# EasyEDA Pro project ProPrj_CraftVia-Core-S-RP235xA-v1-Rev0_2026-11-04.epro, board RPI-RP2350A-MINIMAL_R4-S1
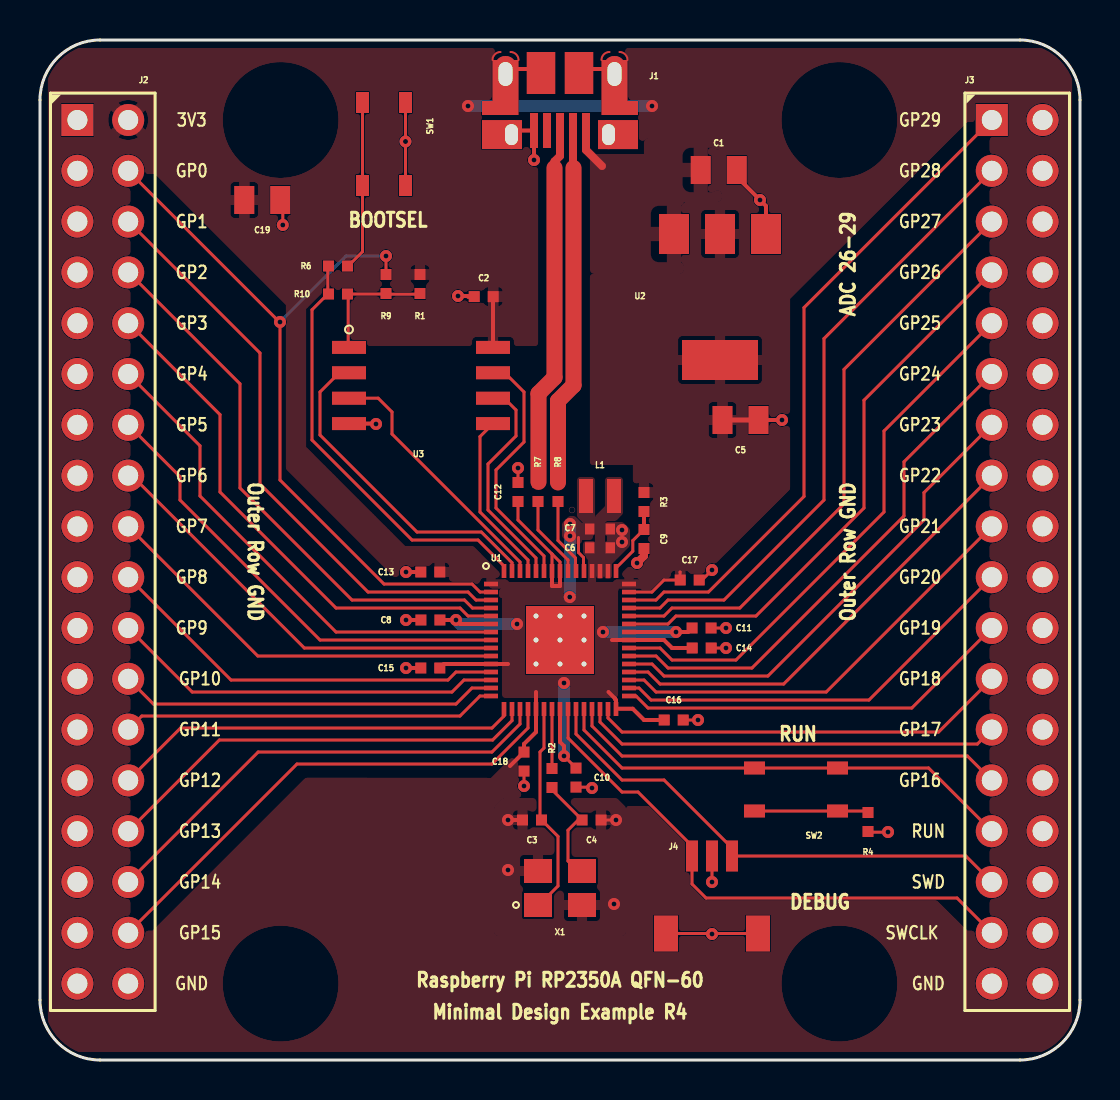
[diagram p4: board, top side]
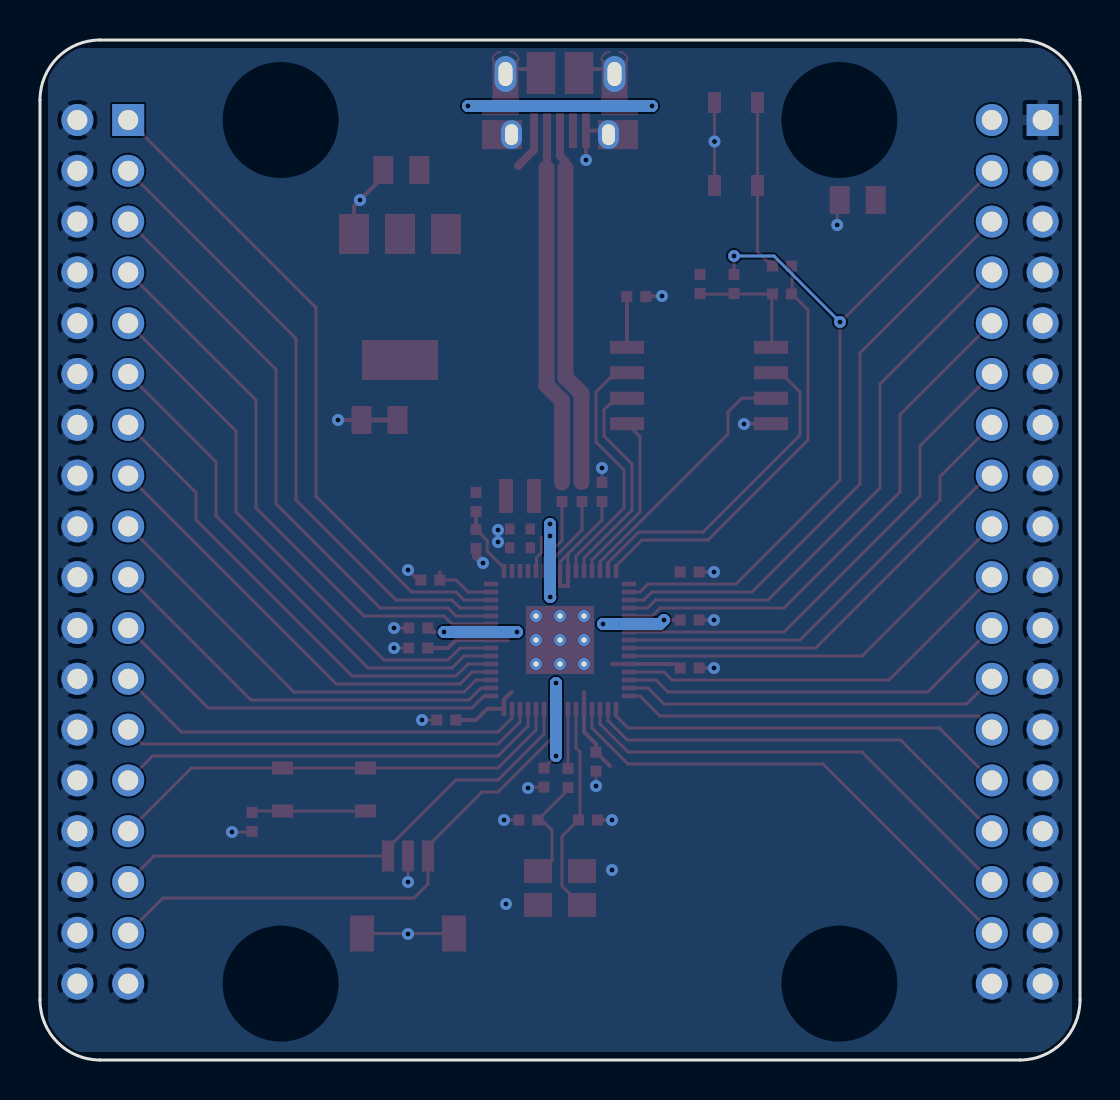
[diagram p5: board, bottom side, seen from below]

Outline 52 x 51 mm; copper layers: Top Layer, Bottom Layer. Coordinates in mm from the lower left corner of the outline.
Outline path: 0,48 arc(0.88,50.12) 3,51 49,51 arc(51.12,50.12) 52,48 52,3 arc(51.12,0.88) 49,0 3,0 arc(0.88,0.88) 0,3 0,48
Stack: Top Layer 0.0009mm / dielectric 1 0.0384mm FR4 er 4.5 / Bottom Layer 0.0009mm

## Design rules (mm)
spacing copperThickness1oz (default): track to track 0.102, other pairs 0.152 to 0.3
track width copperThickness1oz (default): min 0.127, default 0.254, max 2.54
differential pair differentialPair (default): width min 0.127, default 2.54, max 2.54; gap min 0.127, default 0.152
pour e1492 uses copper0
pour e1496 uses copper1
pour e1500 uses copper2
pour e1503 uses copper2
pour e1506 uses copper2
pour e1498 uses copper2
pour e1484 uses copper1
pour e1490 uses copper1
pour e1494 uses copper2
pour e1488 uses copper1
pour e1486 uses copper1
pour e1509 uses copper2

## Placement (name value [footprint] x y rotation side)
C1  10u  [RPI_COMPILED:generic_capc2012x125]  33.94 44.5 0 top
C2  100n  [RPI_COMPILED:generic_capc1005x50]  22.19 38.17 180 top
C3  15p  [RPI_COMPILED:generic_capc1005x50]  24.6 12 180 top
C4  15p  [RPI_COMPILED:generic_capc1005x50]  27.58 12 0 top
C5  10u  [RPI_COMPILED:generic_capc2012x125]  35.03 32 0 top
C6  4.7u  [RPI_COMPILED:generic_capc1005x50_wide]  28 25.61 0 top
C7  4.7u  [RPI_COMPILED:generic_capc1005x50_wide]  28 26.55 0 top
C8  100n  [RPI_COMPILED:generic_capc1005x50]  19.52 22 180 top
C9  4.7u  [RPI_COMPILED:generic_capc1005x50]  30.2 26.05 270 top
C10  100n  [RPI_COMPILED:generic_capc1005x50]  26.8 14.12 270 top
C11  100n  [RPI_COMPILED:generic_capc1005x50]  33.08 21.6 0 top
C12  100n  [RPI_COMPILED:generic_capc1005x50]  23.9 28.4 90 top
C13  100n  [RPI_COMPILED:generic_capc1005x50]  19.51 24.4 180 top
C14  100n  [RPI_COMPILED:generic_capc1005x50]  33.09 20.6 0 top
C15  100n  [RPI_COMPILED:generic_capc1005x50]  19.51 19.6 180 top
C16  100n  [RPI_COMPILED:generic_capc1005x50]  31.69 17 0 top
C17  100n  [RPI_COMPILED:generic_capc1005x50]  32.49 24 0 top
C18  100n  [RPI_COMPILED:generic_capc1005x50]  24.2 14.92 270 top
C19  10u  [RPI_COMPILED:generic_capc2012x125]  11.12 43 0 top
J1  10103594-0001LF  [RPI_COMPILED:amphenol_10103594-0001lf]  26 49.3 180 top
J2  TSW-118-07-L-D  [RPI_COMPILED:samtec_tsw-118-07-l-d]  3.14 25.41 270 top
J3  TSW-118-07-L-D  [RPI_COMPILED:samtec_tsw-118-07-l-d]  48.86 25.41 270 top
J4  SM03B-SRSS-TB(LF)(SN)  [RPI_COMPILED:jst_sm03b-srss-tb-lf--sn-]  33.6 5.62 0 top
L1  3.3u  [RPI_COMPILED:abracon_aota-b201610s3r3-101-t]  28 28.2 0 top
MH1  NPTH FD2.75mm SM3.15mm KO6mm  [RPI_COMPILED:none_mh_npth_fd2p75mm_sm3p15mm_ko6mm]  12.03 47 0 top
MH2  NPTH FD2.75mm SM3.15mm KO6mm  [RPI_COMPILED:none_mh_npth_fd2p75mm_sm3p15mm_ko6mm]  39.97 47 0 top
MH3  NPTH FD2.75mm SM3.15mm KO6mm  [RPI_COMPILED:none_mh_npth_fd2p75mm_sm3p15mm_ko6mm]  39.97 3.82 0 top
MH4  NPTH FD2.75mm SM3.15mm KO6mm  [RPI_COMPILED:none_mh_npth_fd2p75mm_sm3p15mm_ko6mm]  12.03 3.82 0 top
R1  10k  [RPI_COMPILED:generic_resc1005x35]  19 38.8 270 top
R2  1k  [RPI_COMPILED:generic_resc1005x35]  25.6 14.1 270 top
R3  33  [RPI_COMPILED:generic_resc1005x35]  30.2 27.9 270 top
R4  1k  [RPI_COMPILED:generic_resc1005x35]  41.4 11.9 270 top
R6  1k  [RPI_COMPILED:generic_resc1005x35]  14.9 39.7 0 top
R7  27  [RPI_COMPILED:generic_resc1005x35]  24.9 28.4 270 top
R8  27  [RPI_COMPILED:generic_resc1005x35]  25.9 28.4 270 top
R9  0  [RPI_COMPILED:generic_resc1005x35]  17.3 38.8 270 top
R10  0  [RPI_COMPILED:generic_resc1005x35]  14.9 38.3 0 top
SW1  434133025816  [RPI_COMPILED:wurthelek_434133025816]  17.2 45.8 270 top
SW2  434133025816  [RPI_COMPILED:wurthelek_434133025816]  37.8 13.53 180 top
U1  RP2350A  [RPI_COMPILED:rpi_rp2350a_vias]  26 21 0 top
U2  NCP1117ST33T3G  [RPI_COMPILED:onsemi_ncp1117st33t3g]  34 38.15 180 top
U3  W25Q128JVSIQ  [RPI_COMPILED:generic_soic127p790x195-8]  19.05 33.72 0 top
X1  12MHz  [RPI_COMPILED:generic_xtalcc320x250x80-4]  26 8.6 0 top

## Footprints (pads in the part's own frame, mm; a bottom-side part is the same pattern mirrored in y, then rotated)
RPI_COMPILED:abracon_aota-b201610s3r3-101-t
  rect 0.7x1.7 smd: 1(-0.7,0) 2(0.7,0)
RPI_COMPILED:amphenol_10103594-0001lf
  rect 0.4x1.75 smd: 1(-1.3,2.825) 2(-0.65,2.825) 3(0,2.825) 4(0.65,2.825) 5(1.3,2.825)
  rect 2x1.45 smd: 6(-2.9,3.03) 9(2.9,3.03)
  oval 1.05x1.45 hole 0.65x1.05: 6(-2.425,3.03) 9(2.425,3.03)
  custom 1.825x3.15 smd: 7(-2.725,1.4) 10(2.725,1.4)
  oval 1.1x1.8 hole 0.7x1.2: 7(-2.725,0) 10(2.725,0)
  rect 1.425x2.1 smd: 8(-0.95,-0.05) 11(0.95,-0.05)
RPI_COMPILED:generic_capc1005x50
  rect 0.55x0.55 smd: 1(-0.475,0) 2(0.475,0)
RPI_COMPILED:generic_capc1005x50_wide
  rect 0.47x0.55 smd: 1(-0.515,0) 2(0.515,0)
RPI_COMPILED:generic_capc2012x125
  rect 1x1.4 smd: 1(-0.9,0) 2(0.9,0)
RPI_COMPILED:generic_resc1005x35
  rect 0.55x0.55 smd: 1(-0.475,0) 2(0.475,0)
RPI_COMPILED:generic_soic127p790x195-8
  rect 1.7x0.65 smd: 1(-3.6,1.905) 2(-3.6,0.635) 3(-3.6,-0.635) 4(-3.6,-1.905) 5(3.6,-1.905) 6(3.6,-0.635) 7(3.6,0.635) 8(3.6,1.905)
RPI_COMPILED:generic_xtalcc320x250x80-4
  rect 1.4x1.2 smd: 1(-1.1,-0.85) 2(1.1,-0.85) 3(1.1,0.85) 4(-1.1,0.85)
RPI_COMPILED:jst_sm03b-srss-tb-lf--sn-
  rect 0.6x1.55 smd: 1(-1,4.575) 2(0,4.575) 3(1,4.575)
  rect 1.2x1.8 smd: 4(-2.3,0.7) 5(2.3,0.7)
RPI_COMPILED:onsemi_ncp1117st33t3g
  rect 1.5x2 smd: 1(-2.3,-3.15) 2(0,-3.15) 3(2.3,-3.15)
  rect 3.8x2 smd: 4(0,3.15)
RPI_COMPILED:rpi_rp2350a_vias
  rect 0.7x0.23 smd: 1(-3.45,2.8) 2(-3.45,2.4) 3(-3.45,2) 4(-3.45,1.6) 5(-3.45,1.2) 6(-3.45,0.8) 7(-3.45,0.4) 8(-3.45,0) 9(-3.45,-0.4) 10(-3.45,-0.8) 11(-3.45,-1.2) 12(-3.45,-1.6) 13(-3.45,-2) 14(-3.45,-2.4) 15(-3.45,-2.8) 31(3.45,-2.8) 32(3.45,-2.4) 33(3.45,-2) 34(3.45,-1.6) 35(3.45,-1.2) 36(3.45,-0.8) 37(3.45,-0.4) 38(3.45,0) 39(3.45,0.4) 40(3.45,0.8) 41(3.45,1.2) 42(3.45,1.6) 43(3.45,2) 44(3.45,2.4) 45(3.45,2.8)
  rect 0.23x0.7 smd: 16(-2.8,-3.45) 17(-2.4,-3.45) 18(-2,-3.45) 19(-1.6,-3.45) 20(-1.2,-3.45) 21(-0.8,-3.45) 22(-0.4,-3.45) 23(0,-3.45) 24(0.4,-3.45) 25(0.8,-3.45) 26(1.2,-3.45) 27(1.6,-3.45) 28(2,-3.45) 29(2.4,-3.45) 30(2.8,-3.45) 46(2.8,3.45) 47(2.4,3.45) 48(2,3.45) 49(1.6,3.45) 50(1.2,3.45) 51(0.8,3.45) 52(0.4,3.45) 53(0,3.45) 54(-0.4,3.45) 55(-0.8,3.45) 56(-1.2,3.45) 57(-1.6,3.45) 58(-2,3.45) 59(-2.4,3.45) 60(-2.8,3.45)
  round 0.6 hole 0.25: 61(-1.2,1.2) 61(-1.2,0) 61(-1.2,-1.2) 61(0,1.2) 61(0,0) 61(0,-1.2) 61(1.2,1.2) 61(1.2,0) 61(1.2,-1.2)
  rect 3.4x3.4 smd: 61(0,0)
RPI_COMPILED:samtec_tsw-118-07-l-d
  rect 1.6x1.6 hole 1: 1(-21.59,-1.27)
  round 1.6 hole 1: 2(-21.59,1.27) 3(-19.05,-1.27) 4(-19.05,1.27) 5(-16.51,-1.27) 6(-16.51,1.27) 7(-13.97,-1.27) 8(-13.97,1.27) 9(-11.43,-1.27) 10(-11.43,1.27) 11(-8.89,-1.27) 12(-8.89,1.27) 13(-6.35,-1.27) 14(-6.35,1.27) 15(-3.81,-1.27) 16(-3.81,1.27) 17(-1.27,-1.27) 18(-1.27,1.27) 19(1.27,-1.27) 20(1.27,1.27) 21(3.81,-1.27) 22(3.81,1.27) 23(6.35,-1.27) 24(6.35,1.27) 25(8.89,-1.27) 26(8.89,1.27) 27(11.43,-1.27) 28(11.43,1.27) 29(13.97,-1.27) 30(13.97,1.27) 31(16.51,-1.27) 32(16.51,1.27) 33(19.05,-1.27) 34(19.05,1.27) 35(21.59,-1.27) 36(21.59,1.27)
RPI_COMPILED:wurthelek_434133025816
  rect 1.05x0.65 smd: 1(-2.075,1.075) 2(2.075,1.075) 3(-2.075,-1.075) 4(2.075,-1.075)

## Nets
As in the schematic.

Pads without a net: C1 1 2; C2 1 2; C3 1 2; C4 1 2; C5 1 2; C6 1 2; C7 1 2; C8 1 2; C9 1 2; C10 1 2; C11 1 2; C12 1 2; C13 1 2; C14 1 2; C15 1 2; C16 1 2; C17 1 2; C18 1 2; C19 1 2; J1 1 2 3 4 5 6 7 8 9 10 11; J2 1 2 3 4 5 6 7 8 9 10 11 12 13 14 15 16 17 18 19 20 21 22 23 24 25 26 27 28 29 30 31 32 33 34 35 36; J3 1 2 3 4 5 6 7 8 9 10 11 12 13 14 15 16 17 18 19 20 21 22 23 24 25 26 27 28 29 30 31 32 33 34 35 36; J4 1 2 3 4 5; L1 1 2; R1 1 2; R2 1 2; R3 1 2; R4 1 2; R6 1 2; R7 1 2; R8 1 2; R9 1 2; R10 1 2; SW1 1 2 3 4; SW2 1 2 3 4; U1 1 2 3 4 5 6 7 8 9 10 11 12 13 14 15 16 17 18 19 20 21 22 23 24 25 26 27 28 29 30 31 32 33 34 35 36 37 38 39 40 41 42 43 44 45 46 47 48 49 50 51 52 53 54 55 56 57 58 59 60 61; U2 1 2 3 4; U3 1 2 3 4 5 6 7 8; X1 1 2 3 4

## Via types
v1: diameter 0.6, hole 0.25, Top Layer to Bottom Layer, 40 vias

## Routing (per net, layer and track width the routed paths; a pad name or vN(x,y) marks a point on that pad's centre or on a via; arc(x,y) is an arc through that point)
(no net): length 1087.8
  Top Layer w0.15: 24.4,17.56 24.4,16.6 22.6,14.8 12.85,14.8 J2.34 ; J3.31 46.29,10.2 J4.3 34.6,10.6 31.2,14 29.1,14 26.8,16.3 26.8,17.56 ; J2.32 10.91,15.4 22.6,15.4 24,16.8 24,17.56 ; 24.8,24.44 24.8,25.1 22.4,27.5 22.4,29.8 23.8,31.2 23.8,32.5 23.21,33.09 U3.6 ; J3.33 45.85,8.1 33.3,8.1 32.6,8.8 J4.1 32.6,10.7 29.9,13.4 29.1,13.4 26.4,16.1 26.4,17.56 ; J4.2 v1(33.6,8.9) ; J3.5 40.2,34.53 40.2,27.81 34.99,22.6 31.6,22.6 31.2,22.2 29.44,22.2 ; 24,24.44 24,24.9 17.6,31.3 17.6,32.4 16.91,33.09 U3.3 ; 22.56,23.4 22,23.4 21.6,23.8 17.2,23.8 12,29 12,36.87 J2.4 ; 23.9,27.92 23.9,27 25.6,25.3 ; 25.9,27.92 25.9,25.98 26.78,25.1 26.78,24.46 26.8,24.44 ; 27.6,17.56 27.6,16.7 29.1,15.2 46.37,15.2 J3.27 ; 28.4,17.56 28.4,17.1 29.1,16.4 44.93,16.4 J3.23 ; 29.44,18.6 29.95,18.6 30.55,18 41.45,18 J3.19 ; 23.6,17.56 23.6,16.97 22.63,16 8.97,16 J2.30 ; 22.56,20.6 13.22,20.6 4.59,29.22 J2.16 ; J2.6 4.43,41.92 11,35.35 11,28.8 16.4,23.4 21.4,23.4 21.8,23 22.56,23 ; 26.8,13.64 27.56,13.64 v1(27.6,13.6) ; 23.2,24.44 23.2,24.7 21.9,26 18.6,26 13.6,31 13.6,37.51 14.39,38.3 14.39,39.7 ; J2.14 7,29.17 7,28 14,21 22.56,21 ; 22.56,19 21.2,19 20.6,18.4 7.61,18.4 J2.22 ; 32,24.4 32,24.39 32,24 ; 18.28,43.72 18.28,47.88 v1(18.28,45.92) ; C17.2 33.1,24 v1(33.6,24.5) ; 22.56,18.6 21.6,18.6 20.8,17.8 5.67,17.8 J2.24 ; 29.44,20.6 31,20.6 31.6,20 34.8,20 42.2,27.4 42.2,31.45 J3.9 ; J3.25 46.87,15.8 29.1,15.8 28,16.9 28,17.56 ; 17.3,39.31 v1(17.3,40.2) ; 30.2,26.53 29.64,25.97 29.64,25.44 28.8,24.6 ; J3.7 41.2,32.99 41.2,27.6 35.8,22.2 31.8,22.2 31.4,21.8 29.44,21.8 ; J3.1 47.58,47 38.2,37.62 38.2,28.18 33.42,23.4 31.2,23.4 30.8,23 29.44,23 ; 25.6,25.3 26,24.9 26,24.44 ; 25.6,25.3 25.6,24.44 ; J3.3 39.2,36.07 39.2,28 34.2,23 31.4,23 31,22.6 29.44,22.6 ; 29.44,18.2 29.8,18.2 30.4,17.6 43.59,17.6 J3.21 ; J3.15 47.59,29.2 37.19,18.8 31,18.8 30.4,19.4 29.44,19.4 ; J2.28 7.03,16.6 22.6,16.6 23.2,17.2 23.2,17.56 ; 23.6,24.44 23.6,24.86 22.06,26.4 18.85,26.4 14,31.25 14,33.4 14.96,34.36 U3.2 ; J4.4 33.57,6.33 v1(33.6,6.3) 33.62,6.33 J4.5 ; J2.26 5.09,17.2 21,17.2 22,18.2 22.56,18.2 ; SW1.3 16.12,40.42 15.41,39.7 ; v1(32.9,17) 32.17,17 ; J3.13 44.2,28.37 44.2,27 36.4,19.2 31.2,19.2 30.6,19.8 29.44,19.8 ; J3.29 44.43,14.6 29.1,14.6 27.2,16.5 27.2,17.56 ; 26.4,24.44 26.4,25 24.9,26.5 24.9,27.92 ; 27.2,24.44 27.18,24.46 27.18,25.12 26.93,25.38 26.93,26.12 ; 26.9,9.45 26.4,9.95 26.4,11.49 26.91,12 27.11,12 25.6,13.51 25.6,13.63 ; 29.44,20.2 30.8,20.2 31.4,19.6 35.6,19.6 43.2,27.2 43.2,29.91 J3.11 ; v1(34.3,20.6) 33.57,20.6 ; J2.18 10.89,20.2 22.56,20.2 ; U3.7 23.24,34.36 24.2,33.4 24.2,30.9 22.8,29.5 22.8,27.6 25.2,25.2 25.2,24.44 ; 12.14,43 v1(12.14,41.75) ; 24.7,7.75 24.95,7.75 25.9,8.7 25.9,11.18 25,12.08 25,15.4 25.2,15.6 25.2,17.56 ; J2.10 4.43,36.84 9,32.27 9,28.4 14.8,22.6 21,22.6 21.4,22.2 22.56,22.2 ; 24.2,14.44 v1(24.2,13.7) ; 41.4,12.41 41.36,12.45 SW2.1 35.72,12.45 ; v1(34.3,21.6) 33.56,21.6 ; 32,24 31.2,24 30.6,23.4 29.44,23.4 ; J2.20 9.55,19 20.4,19 20.8,19.4 22.56,19.4 ; 41.4,11.39 42.39,11.39 v1(42.4,11.4) ; v1(28.8,12) 28.08,12 ; 14.93,35.63 U3.1 15.41,35.67 15.41,38.3 17.29,38.3 17.3,38.29 19,38.29 ; 25.6,17.56 25.6,14.6 ; U3.5 22,31.17 22,27.4 24.4,25 24.4,24.44 ; 22.56,22.6 21.62,22.6 21.22,23 15.6,23 10,28.6 10,33.81 4.43,39.38 J2.8 ; v1(23.9,29.6) 23.9,28.88 ; J2.12 8,30.71 8,28.2 14.8,21.4 22.56,21.4 ; 29.44,19 30.2,19 30.8,18.4 39.31,18.4 J3.17 ; v1(26.2,15.2) 26.8,14.6
  Top Layer w0.2: 22.67,38.17 22.65,38.15 U3.8 ; U2.1 36.3,42.7 v1(36,43) 34.88,44.12 34.88,44.5 ; 29.44,21.4 v1(31.8,21.4) 32.4,21.4 32.6,21.6 ; 28.42,18.4 28.75,18.07 28.75,18.05 28.8,18 28.8,17.56 29.64,17.56 30.2,17 31.2,17 ; 36.05,32 v1(37.1,32) ; 25.6,24.44 25.6,23.7 26,23.7 26,24.44 ; v1(20.9,38.2) 21.38,38.2 21.41,38.17 21.7,38.17 ; 23.4,19.8 20.2,19.8 20,19.6 ; 22.56,21.8 21,21.8 v1(20.8,22) 20,22 ; 32.6,20.6 31.6,20.6 31.2,21 28.6,21 ; 26.96,49.55 28.46,49.55 28.73,49.28 ; 24.12,12 v1(23.4,12) ; 24.7,46.4 v1(24.7,45) ; 19.04,22 v1(18.3,22) ; J1.5 23.78,46.47 J1.9 ; 19.03,19.6 v1(18.3,19.6) ; 19.03,24.4 v1(18.3,24.4) ; 23.27,49.28 23.54,49.55 25.04,49.55 ; v1(26.2,15.2) 26.2,15.7 26,15.9 26,17.56 ; U3.4 16.78,31.82 v1(16.8,31.8) ; 30.2,26.53 30.2,27.39 ; 28.8,24.44 28.8,24.6 ; 24.8,18.4 24.8,16.4 24.2,15.8 24.2,15.4 23.5,14.7
  Top Layer w0.254: C5.2 C5.1
  Top Layer w0.4: J1.1 27.3,45.5 28.1,44.7 ; J1.3 26,45.2 25.72,44.92 25.72,44.6 ; 30.2,25.57 30.2,25.2 v1(29.85,24.85) ; J1.2 26.65,44.62 26.68,44.6
  Top Layer w0.8: 26.68,44.6 26.68,33.73 25.9,32.96 25.9,28.88 ; 24.93,28.91 24.93,33.33 25.72,34.12 25.72,44.6
  Bottom Layer w0.15: v1(12,36.9) 15.3,40.2 v1(17.3,40.2)
  Bottom Layer w0.6: v1(26.2,18.85) v1(26.2,15.2) ; v1(31.8,21.4) v1(28.15,21.4) ; v1(26.5,26.8) 26.5,23.16 v1(26.49,23.15) ; v1(20.8,22) 21,21.8 v1(23.85,21.8) ; v1(21.4,47.7) v1(30.6,47.7)
  vias: v1(23.4,9.5) v1(26.5,26.2) v1(28.7,7.8) v1(29.1,26.5) v1(29.1,25.9)

## Copper pours and planes (outline as drawn; the poured copper is in the pictures)
(no net) on Top Layer: 27.65,26.3 27.65,29.05 26.95,29.05 26.95,27.2 27.25,26.9 27.25,26.75 27.05,26.75 26.7,27.1 26.5,27.1 26.2,26.8 26.2,26.2 26.5,25.9 27,25.9 27,26.1 27.55,26.1 27.55,26.3
(no net) on Top Layer: 51.5,0.5 0.5,0.5 0.5,50.5 51.5,50.5
(no net) on Top Layer: 28.2,18.8 23.8,18.8 23.8,23.2 28.2,23.2
(no net) on Top Layer: 28.3,24.15 28.3,25.85 28.45,25.85 28.45,26.3 28.3,26.3 28.3,26.8 29.1,26.8 29.4,26.5 29.4,25.75 28.5,24.85 28.5,24.15
(no net) on Top Layer: 34,43 32.1,43 32.1,39.4 27.6,39.4 27.6,45.2 30.3,45.2 30.3,46 34,46
(no net) on Top Layer: 24.8,44.8 24.8,35.8 15.4,35.8 15.4,38.4 14,38.4 13.2,37.6 13.2,30.6 18.2,25.6 21.6,25.6 23.4,23.8 28.7,23.8 29.75,24.85 29.75,29.85 27.6,29.85 27.6,44.8
(no net) on Top Layer: 27.9,24.15 27.9,24.95 27.85,25 27.85,27.15 28.35,27.65 28.35,29.05 29.05,29.05 29.05,27.35 28.75,27.05 28.3,27.05 28.15,26.9 28.15,25 28.1,24.95 28.1,24.15
(no net) on Top Layer: 46.32,47 37.4,38.11 37.4,28.58 33,24.2 31.1,24.2 30.5,23.6 28.9,23.6 28.8,23.5 28.8,23.2 18.8,23.2 12.4,29.6 12.4,37.8 5.8,44.4 4.41,44.4 4.41,6.36 5.68,6.36 13.33,14.01 22.6,14 24,15.4 24.2,15.4 24.2,12.6 40,12.6 46.32,6.36 47.59,6.36 47.59,47
(no net) on Top Layer: 28.8,18.2 23.2,18.2 23.2,23.8 28.8,23.8
(no net) on Top Layer: 23.2,13 28.8,13 29.2,12.6 29.2,6.3 22.8,6.3 22.8,12.6
(no net) on Bottom Layer: 51.5,0.5 0.5,0.5 0.5,50.5 51.5,50.5

Small or netless copper shapes (teardrops, artwork), in the pictures only: 1 on Top Layer

## Text on the board
Top Silkscreen Layer: 3V3 | GP0 | GP1 | GP2 | GP3 | GP4 | GP5 | GP6 | GP7 | GP8 | GP9 | GND | GP10 | GP11 | GP12 | GP13 | GP14 | GP15 | SWCLK | GP29 | GP28 | GP27 | GP26 | GP25 | GP24 | GP23 | GP22 | GP21 | GP20 | GP19 | GP18 | GP17 | GP16 | RUN | SWD | BOOTSEL | Raspberry Pi RP2350A QFN-60 | Minimal Design Example R4 | DEBUG | ADC 26-29 | Outer Row GND
